# Altium schematic sheet Buzzer.SchDoc
size A4; SheetNumber: 7; SheetTotal: 7
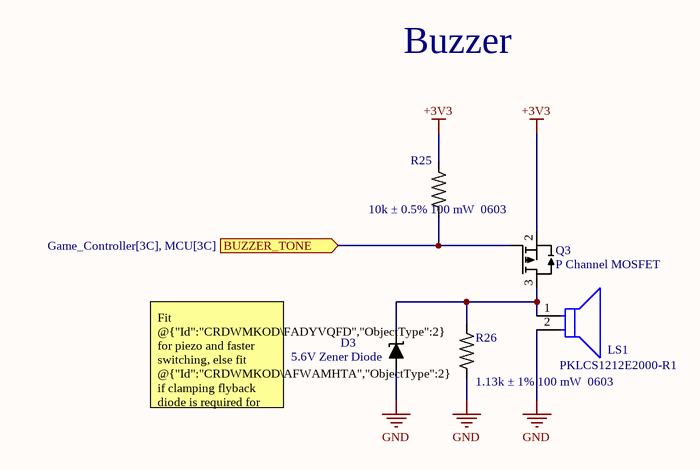
[diagram p0: Buzzer.SchDoc]

## Parts
D3  5.6V Zener Diode  [SOT23-3]
LS1  PKLCS1212E2000-R1  [FP-PKLCS1212E2000-R1-MFG]
Q3  P Channel MOSFET  [SOT23-3]
R25  10k ± 0.5% / 100 mW / 0603  [0603_RES]
R26  1.13k ± 1% / 100 mW / 0603  [0603_RES]

## Ports
BUZZER_TONE (in, see Game_Controller[3C], MCU[3C])

## Nets
+3V3: Q3.2(S) R25.2
GND: D3.1(A) LS1.2 R26.2
BUZZER_TONE: Q3.1(G) R25.1 ; port BUZZER_TONE
NetD3_3: D3.3(K) LS1.1 Q3.3(D) R26.1

## Notes on the sheet
- Buzzer
- Fit @{"Id":"CRDWMKOD\FADYVQFD","ObjectType":2} for piezo and faster switching, else fit @{"Id":"CRDWMKOD\AFWAMHTA","ObjectType":2} if clamping flyback diode is required for inductive buzzer

## Library data of the parts
D3 = 29: Manufacturer: Vishay; CID: 29; Manufacturer Part Number: BZX84C5V6-E3-08
LS1 = CMP-06202-000001-1: AUDIO PIEZO TRANSDUCER 12.5V SMD; Manufacturer: Murata; Frequency: 2kHz; Description: Buzzers Transducer, Externally Driven Piezo 1.5V  2kHz 70dB @ 1.5V, 10cm Surface Mount Solder Pads; Digikey Description: AUDIO PIEZO TRANSDUCER 12.5V SMD; RoHS: TRUE; Device Class L3: Buzzers; Manufacturer Part Number: PKLCS1212E2000-R1; Automotive: No; Category: Speak; Height: 3mm; Operating Supply Voltage: 12.5V; Mouser Description: Piezo buzzer SMD; Temperature Range High: +70°C; Temperature Range Low: -20°C; ComponentLink2Description: Datasheet; ComponentLink2URL: https://www.murata.com/en-global/products/productdata/8801054425118/SPEC-PKLCS1212E2000-R1.pdf?1517839212000; Package: PKLCS1212E2000-R1; Device Class L1: Electromechanical; Device Class L2: Audio Products; Lead Free: Yes; Temperature: -20°C to +70°C; Octopart: https://octopart.com/pklcs1212e2000-r1-murata-7123179
Q3 = 28: Manufacturer: Vishay; CID: 28; Manufacturer Part Number: SI2301CDS-T1-E3
R25 = 6: Manufacturer: Yageo; Manufacturer Part Number: AC0603DRE0710KL; CID: 6
R26 = 10: Manufacturer: Yageo; Manufacturer Part Number: RC0603FR-071K13L; CID: 10